# Altium schematic sheet Comunicaciones.SchDoc
size A4; SheetNumber: 3; SheetTotal: 3
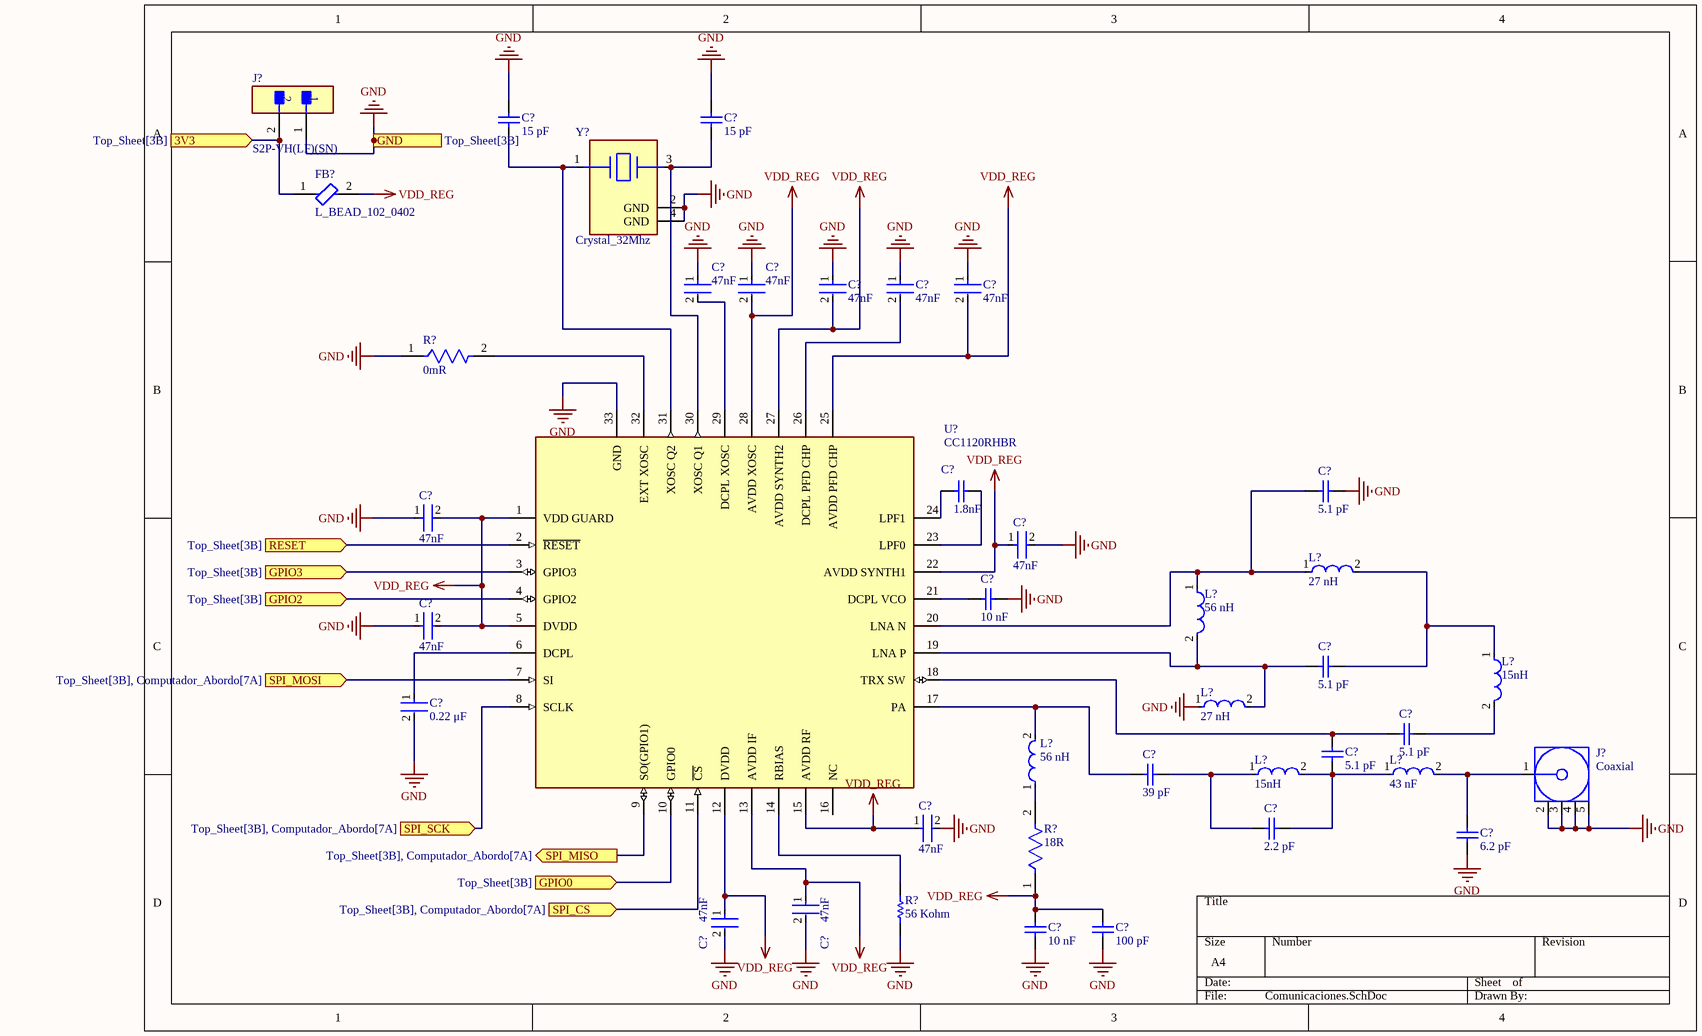
[diagram p0: Comunicaciones.SchDoc]

## Parts
(Parts that share a designator on the sheet are numbered #1, #2 ... from top to bottom, then left to right.)
C?#1  15 pF  [CAPC1005X55X25LL05T10]
C?#2  15 pF  [CAPC1005X55X25LL05T10]
C?#3  47nF  [FP-GRM155-0_05-IPC_A]
C?#4  47nF  [FP-GRM155-0_05-IPC_A]
C?#5  47nF  [FP-GRM155-0_05-IPC_A]
C?#6  47nF  [FP-GRM155-0_05-IPC_A]
C?#7  47nF  [FP-GRM155-0_05-IPC_A]
C?#8  1.8nF  [CAPC1005X55X25LL05T10]
C?#9  5.1 pF  [CAPC1005X55X25LL05T10]
C?#10  47nF  [FP-GRM155-0_05-IPC_A]
C?#11  47nF  [FP-GRM155-0_05-IPC_A]
C?#12  10 nF  [CAPC1005X55X25LL05T10]
C?#13  47nF  [FP-GRM155-0_05-IPC_A]
C?#14  5.1 pF  [CAPC1005X55X25LL05T10]
C?#15  0.22 μF  [FP-C0603C-CF-IPC_B]
C?#16  5.1 pF  [CAPC1005X55X25LL05T10]
C?#17  5.1 pF  [CAPC1005X55X25LL05T10]
C?#18  39 pF  [CAPC1005X55X25LL05T10]
C?#19  2.2 pF  [CAPC1005X55X25LL05T10]
C?#20  47nF  [FP-GRM155-0_05-IPC_A]
C?#21  6.2 pF  [CAPC1005X60X25ML10T15]
C?#22  47nF  [FP-GRM155-0_05-IPC_A]
C?#23  47nF  [FP-GRM155-0_05-IPC_A]
C?#24  100 pF  [CAPC1005X55X25LL05T10]
C?#25  10 nF  [CAPC1005X55X25LL05T10]
FB?  L_BEAD_102_0402  [FP-BLM15-0_05-IPC_C]
J?#1  S2P-VH(LF)(SN)  [FP-S2P-VH_LF_SN-MFG]
J?#2  Coaxial  [60312202114512]
L?#1  27 nH  [FP-LQW15AN_00-W0_5-0_1-MFG]
L?#2  56 nH  [FP-LQW15AN_00-W0_5-0_1-MFG]
L?#3  15nH  [FP-LQW15AN_00-W0_6-0_1-MFG]
L?#4  27 nH  [FP-LQW15AN_00-W0_5-0_1-MFG]
L?#5  15nH  [FP-LQW15AN_00-W0_6-0_1-MFG]
L?#6  43 nF  [FP-LQW15AN_00-W0_5-0_1-MFG]
L?#7  56 nH  [FP-LQW15AN_00-W0_5-0_1-MFG]
R?#1  0mR  [FP-RK73Z1E-IPC_B]
R?#2  18R  [FP-RMCF0402-IPC_B]
R?#3  56 Kohm  [RESC1005X40X25ML10T10]
U?  CC1120RHBR  [FP-RHB0032E-MFG]
Y?  Crystal_32Mhz  [FP-ABM10W-MFG]

## Ports
3V3 (in, see Top_Sheet[3B]), GND (in, see Top_Sheet[3B]), GPIO0 (in, see Top_Sheet[3B]), GPIO2 (in, see Top_Sheet[3B]), GPIO3 (in, see Top_Sheet[3B]), RESET (in, see Top_Sheet[3B]), SPI_CS (in, see Top_Sheet[3B], Computador_Abordo[7A]), SPI_MISO (out, see Top_Sheet[3B], Computador_Abordo[7A]), SPI_MOSI (in, see Top_Sheet[3B], Computador_Abordo[7A]), SPI_SCK (in, see Top_Sheet[3B], Computador_Abordo[7A])

## Nets
GND: C?#1.2 C?#2.2 C?#3.1 C?#4.1 C?#5.1 C?#6.1 C?#7.1 C?#9.1 C?#10.1 C?#11.2 C?#12.2 C?#13.1 C?#15.2 C?#20.2 C?#21.1 C?#22.2 C?#23.2 C?#24.2 C?#25.1 J?#1.1 J?#2.2(GND) J?#2.3(GND) J?#2.4(GND) J?#2.5(GND) L?#4.1 R?#1.1 R?#3.1 U?.33(GND) Y?.2(GND) Y?.4(GND) ; port GND
VDD_REG: C?#4.2 C?#5.2 C?#7.2 C?#10.2 C?#11.1 C?#13.2 C?#20.1 C?#22.1 C?#23.1 C?#24.1 C?#25.2 FB?.2 R?#2.1 U?.1(VDD_GUARD) U?.5(DVDD) U?.12(DVDD) U?.13(AVDD_IF) U?.15(AVDD_RF) U?.22(AVDD_SYNTH1) U?.25(AVDD_PFD_CHP) U?.27(AVDD_SYNTH2) U?.28(AVDD_XOSC)
3V3: FB?.1 J?#1.2 ; port 3V3
GPIO0: U?.10(GPIO0) ; port GPIO0
GPIO2: U?.4(GPIO2) ; port GPIO2
GPIO3: U?.3(GPIO3) ; port GPIO3
RESET: U?.2(~{RESET}) ; port RESET
SPI_CS: U?.11(~{CS}) ; port SPI_CS
SPI_MISO: U?.9(SO(GPIO1)) ; port SPI_MISO
SPI_MOSI: U?.7(SI) ; port SPI_MOSI
SPI_SCK: U?.8(SCLK) ; port SPI_SCK
NetC?#1_1: C?#1.1 U?.31(XOSC_Q2) Y?.1
NetC?#2_1: C?#2.1 U?.30(XOSC_Q1) Y?.3
NetC?#3_2: C?#3.2 U?.29(DCPL_XOSC)
NetC?#6_2: C?#6.2 U?.26(DCPL_PFD_CHP)
NetC?#8_1: C?#8.1 U?.23(LPF0)
NetC?#8_2: C?#8.2 U?.24(LPF1)
NetC?#9_2: C?#9.2 L?#1.1 L?#2.1 U?.20(LNA_N)
NetC?#12_1: C?#12.1 U?.21(DCPL_VCO)
NetC?#14_1: C?#14.1 L?#1.2 L?#3.1
NetC?#14_2: C?#14.2 L?#2.2 L?#4.2 U?.19(LNA_P)
NetC?#15_1: C?#15.1 U?.6(DCPL)
NetC?#16_1: C?#16.1 C?#17.2 U?.18(TRX_SW)
NetC?#16_2: C?#16.2 C?#19.2 L?#5.2 L?#6.1
NetC?#17_1: C?#17.1 L?#3.2
NetC?#18_1: C?#18.1 L?#7.2 U?.17(PA)
NetC?#18_2: C?#18.2 C?#19.1 L?#5.1
NetC?#21_2: C?#21.2 J?#2.1(Signal) L?#6.2
NetL?#7_1: L?#7.1 R?#2.2
NetR?#1_2: R?#1.2 U?.32(EXT_XOSC)
NetR?#3_2: R?#3.2 U?.14(RBIAS)

Not connected (* = marked no-connect by the designer): U? 16(NC)

## Library data of the parts
C?#1 C?#2 = C_15P_0402_NP0_J_50: Part Number: GRM1555C1H150JZ01D; Manufacturer: Murata; Value: 15 pF
C?#3-C?#7 C?#10 C?#11 C?#13 C?#20 C?#22 C?#23 = C_47N_0402_X7R_K_25: Chip Multilayer Ceramic Capacitors for General Purpose, 0402, 47000pF, X7R, 15%, 10%, 25V; Depth: 0.5mm; Capacitance: 47nF; Case/Package: 0402; Tolerance: 10%; REACH SVHC: No SVHC; Termination: SMD/SMT; Number of Pins: 2; Mount: Surface Mount; Radiation Hardening: No; Height: 0.5mm; Min Operating Temperature: -55°C; Max Operating Temperature: 125°C; Thickness: 0.022inch; Length: 1mm; Voltage Rating (DC): 25V; Material: Ceramic; Lead Free: Lead Free; Packaging: Tape and Reel; Dielectric: X7R; Voltage: 25V; Case Code (Metric): 1005; Width: 0.02inch; Case Code (Imperial): 0402; Voltage Rating: 25V; Package Quantity: 1
C?#8 = C_1N8_0402_U2J_J_10: GRM1557U1A182JA01D; Manufacturer: Murata; Part Number: GRM1557U1A182JA01D; Value: 1.8nF
C?#9 C?#14 C?#16 C?#17 = C_5P1_0402_NP0_C_50: Part Number: GRM1555C1H5R1CZ01D; Manufacturer: Murata; Value: 5.1 pF
C?#12 C?#25 = C_10N_0402_X7R_K_25: Manufacturer: Murata; Part Number: GRM155R71E103KA01D; Value: 10 nF
C?#15 = C_220N_0402_X5R_K_10: C0603 0.22 μF X7R 30ppm/°C 10.00% 10 V; Manufacturer Part Number: C0603C224K8RAC; Manufacturer: KEMET; Automotive Grade: Grade 1; Material: Ceramic; Voltage Rating: 10 V; Tolerance: 0.1; Capacitance: 0.22 μF; Device Class L2: Capacitors; Temperature Range High: +125°C; RoHS: TRUE; Device Class L1: Passive Components; Temperature: -55°C to +125°C; Temperature Coefficient: 30ppm/°C; ComponentLink2Description: Datasheet; Device Class L3: Ceramic Capacitors; ComponentLink2URL: https://api.kemet.com/component-edge/download/datasheet/C0603C100J5GACAUTO.pdf; Value: 0.22 μF; Category: Cap; Lead Free: Yes; Automotive: Yes; Height: 0.87mm; Temperature Characteristic: X7R; Mouser Description: Multilayer Ceramic Capacitors MLCC - SMD/SMT 50volts 0.22 uF C0G X7R; Octopart: https://octopart.com/c0603c224k8rac-kemet-7455784; Package: C0603C-CF; Temperature Range Low: -55°C
C?#18 = C_39P_0402_NP0_J_50: Chip Capacitor, 39 pF, +/- 5%, 50 V, -55 to 125 degC, 0402 (1005 Metric), RoHS, Tape and Reel; PartNumber: GRM1555C1H390JZ01D; Voltage Rating (DC): 50 V; Type (Capacitors): C0G; Case\/Package: 0402; Length: 0.039 inch; RoHSCompliant: true; ComponentLink1URL: http://www.murata.com/; Packaging: Tape and Reel; Lead Pitch: 2 mm; PackageDescription: 2-Pin Surface Mount Device, Body 1 x 0.5 mm; PackageReference: 0402; Case Code (Metric): 1005; Pins: 2; Capacitance: 39 pF; Mounting Technology: Surface Mount; DatasheetVersion: 09/2016; REACH SVHC: No SVHC; Radiation Hardening: No; ComponentLink2Description: Datasheet; ComponentLink1Description: Manufacturer URL; Height: 0.5 mm; Package Quantity: 10000; Case Code (Imperial): 0402; Width: 0.02 inch; ComponentLink2URL: http://psearch.en.murata.com/capacitor/product/GRM1555C1H390JZ01_.pdf; Voltage Rating: 50 V; Max Operating Temperature: 125 degC; Min Operating Temperature: -55 degC; Mount: Surface Mount; Tolerance: 5%
C?#19 = C_2P2_0402_NP0_C_50: Manufacturer: Murata; Part Number: GRM1555C1H2R2CZ01D; Value: *
C?#21 = C_6P2_0402_NP0_C_50: Manufacturer: AVX Interconnect / Elco; Part Number: 04025A6R2CAT2A; Value: 6.2 pF
C?#24 = C_100P_0402_NP0_J_50: Part Number: GRM1555C1H101JZ01D; Manufacturer: Murata; Value: 100 pF
FB? = L_BEAD_102_0402: Chip Ferrite Bead, 0402, 1000Ω @ 100MHz, 1.1Ω, 25%, 250mA; Number of Circuits: 1; DC Resistance-Max: 1.1R; Impedance: 1kR; Material: Steel; Shielding: Unshielded; Number of Pins: 2; REACH SVHC: No SVHC; Case/Package: 0402; Core Material: Ferrite; Packaging: Tape and Reel; Max DC Current: 250mA; Test Frequency: 100MHz; Case Code (Metric): 1005; Height: 0.5mm; Military Standard: Not; Max Operating Temperature: 125°C; Termination: SMD/SMT; Tolerance: 25%; Length: 1mm; Number of Lines: 1; Min Operating Temperature: -55°C; Depth: 0.5mm; Case Code (Imperial): 0402; DC Current: 250mA; Contact Plating: Tin; Series: BLM15H; Radiation Hardening: No; Width: 0.5mm; DC Resistance (DCR): 1.1R; Max Current Rating: 250mA; Current Rating: 250mA; Package Quantity: 1; Lead Free: Lead Free; Frequency: 100MHz
J?#1 = CMP-17439-000358-1: CONN HEADER R/A 2POS 3.96MM; Max Current Rating: 10A; Max Voltage Rating (AC): 250V; Contact Resistance: 20mR; Number of Positions: 2; Housing Color: White; Packaging: Box; Termination: Solder; Number of Rows: 1; Length: 7.86mm; Orientation: Right Angle; Pitch: 3.96mm; Min Operating Temperature: -25°C; Contact Plating: Copper; Max Operating Temperature: 85°C; Lead Free: Lead Free; Housing Material: Polyamide; Contact Material: Brass
J?#2 = SMA-10V21-TGG: Rf Coax Conn, Sma Jack, 50 Ohm, Pcb Rohs Compliant: Yes |Wurth Elektronik 60312202114512; Impedance: 50Ω; Insulation Resistance: 5GΩ; Insertion Loss (dB): 0.14dB; Min Operating Temperature: -65°C; Max Operating Temperature: 165°C; Orientation: Straight; Connector Type: SMA; Insulation Material: PTFE
L?#1 L?#4 = L_27N_0402_J_LQW: Wire Wound RF Inductor 27nH ±5% 280mA 0.52Ω 0402 (1005); Test Frequency: 100MHz; DC Resistance (DCR): 520mR; Q Factor: 25; Self Resonant Frequency: 3.5GHz; Core Material: Air; Shielding: Unshielded; Mount: Surface Mount; Package Quantity: 10000; Max Operating Temperature: 125°C; Termination: SMD/SMT; Weight: 2.8E-05oz; Case Code (Metric): 1005; Radiation Hardening: No; Case Code (Imperial): 0402; Military Standard: Not; Packaging: Tape and Reel; Tolerance: 5%; Lead Free: Lead Free; Depth: 0.6mm; DC Current: 280mA; Inductance: 27nH; Current Rating: 280mA; Min Operating Temperature: -55°C; Width: 0.02inch; Height: 0.5mm; Length: 1mm; Max DC Current: 280mA; Case/Package: 0402; Resistor Type: Wirewound; Value: 27 nH
L?#2 L?#7 = L_56N_0402_J_LQW: Wire Wound RF Inductor 56nH ±5% 200mA 1.17Ω 0402 (1005); Test Frequency: 100MHz; Shielding: Unshielded; Self Resonant Frequency: 2.8GHz; Core Material: Air; Q Factor: 25; DC Resistance (DCR): 1.17R; Termination: SMD/SMT; Case Code (Imperial): 0402; Resistor Type: Wirewound; Mount: Surface Mount; Tolerance: 5%; Lead Free: Lead Free; Height: 0.5mm; Packaging: Tape and Reel; Min Operating Temperature: -55°C; Max DC Current: 200mA; Case/Package: 0402; Package Quantity: 10000; Military Standard: Not; Current Rating: 200mA; DC Current: 200mA; Inductance: 56nH; Depth: 0.6mm; Radiation Hardening: No; Case Code (Metric): 1005; Max Operating Temperature: 125°C; Length: 1mm; Weight: 2.8E-05oz; Width: 0.5mm; =Value: 56 nH
L?#3 L?#5 = L_15N_0402_J_LQW: Wire Wound RF Inductor 15nH ±5% 460mA 0.16Ω 0402 (1005); Test Frequency: 100MHz; DC Resistance (DCR): 160mR; Shielding: Unshielded; Q Factor: 30; Core Material: Air; Self Resonant Frequency: 5GHz; Resistor Type: Wirewound; DC Current: 460mA; Inductance: 15nH; Weight: 2.8E-05oz; Radiation Hardening: No; Depth: 0.7mm; Package Quantity: 10000; Case/Package: 0402; Packaging: Tape and Reel; Length: 1mm; Max DC Current: 460mA; Case Code (Imperial): 0402; Tolerance: 5%; Min Operating Temperature: -55°C; Lead Free: Lead Free; Width: 0.02inch; Case Code (Metric): 1005; Termination: SMD/SMT; Military Standard: Not; Current Rating: 460mA; Height: 0.5mm; Mount: Surface Mount; Max Operating Temperature: 125°C
L?#6 = L_43N_0402_J_LQW: Wire Wound RF Inductor 43nH ±5% 250mA 0.7Ω 0402 (1005); Test Frequency: 100MHz; Current: 145mA; Core Material: Air; Self Resonant Frequency: 3GHz; DC Resistance (DCR): 700mR; Shielding: Unshielded; Q Factor: 25; REACH SVHC: No SVHC; Case/Package: 0402; Package Quantity: 1; Termination: SMD/SMT; Max Operating Temperature: 125°C; Case Code (Imperial): 0402; Height: 0.5mm; DC Current: 250mA; Inductance Tolerance: 5%; Length: 1mm; Tolerance: 5%; Max DC Current: 250mA; Min Operating Temperature: -55°C; Depth: 0.6mm; Radiation Hardening: No; Inductance: 43nH; Military Standard: Not; Packaging: Tape and Reel; Current Rating: 250mA; Case Code (Metric): 1005; Width: 0.02inch; Weight: 2.8E-05oz; Mount: Surface Mount; Value: 43 nF
R?#1 = R_0_0402: RES 0 OHM JUMPER 0402; Power Rating: 1W; Tolerance: 5%; Temperature Coefficient: 200ppm/°C; Max Operating Temperature: 155°C; Case Code (Imperial): 0402; RoHS Compliant: Yes; Case Code (Metric): 1005; Construction: Rectangular; Series: RK73Z; Military Standard: Not; Resistance: 0mR; Package Quantity: 10000; Lead Free: Lead Free; Packaging: Tape and Reel; Case/Package: 0402; Resistor Type: Thick Film; Min Operating Temperature: -55°C; Width: 0.5mm; Depth: 0.5mm; Termination: SMD/SMT; Height: 0.35mm; Length: 1mm
R?#2 = R_18_0402_J: 18Ω ±5% 0.063W 0402 Thick Film Chip Resistor AEC-Q200 compliant; Max Power Dissipation: 63mW; Temperature Coefficient: 100ppm/°C; Lead Free: Lead Free; Resistor Type: Thick Film; Packaging: Tape and Reel; Tolerance: 5%; Resistance: 18R; Contact Plating: Tin; Mount: Surface Mount; Min Operating Temperature: -55°C; Case/Package: 0402; Case Code (Metric): 1005; Number of Terminations: 2; Series: RMCF; Length: 0.039inch; Width: 0.02inch; Height: 0.016inch; RoHS Compliant: Yes; Features: Automotive AEC-Q200; Max Operating Temperature: 155°C; Case Code (Imperial): 0402
R?#3 = R_56K_0402_F: Part Number: RK73H1ETTP5602F; Manufacturer: KOA Speer; Value: 56 Kohm
U? = CMP-04924-000017-1: IC RF TXRX+MCU ISM<1GHZ 32VFQFN; Min Supply Voltage: 2V; Max Frequency: 480MHz; Frequency: 960MHz; Sensitivity: -127dBm; Max Supply Voltage: 3.6V; Current - Receiving: 23mA; Number of Receivers: 1; Data Rate: 200Kbps; Current - Transmitting: 54mA; Interface: SPI; Min Frequency: 164MHz; Density: 0B; Output Power (dBm): 16dBm; RoHS Compliant: Yes; Package Quantity: 1; Lead Free: Lead Free; Number of Transmitters: 1; Max Operating Temperature: 85°C; REACH SVHC: No SVHC; Min Operating Temperature: -40°C; Radiation Hardening: No; Series: CC1120; Number of Pins: 32; Packaging: Tape and Reel; Case/Package: VQFN; Mount: Surface Mount
Y? = Crystal_32Mhz: Crystal 32MHz ±10ppm 6pF SMD-4 2.5mm x 2mm